# Altium schematic sheet power.schdoc
size 400 x 277 mm; Device: default420x297; Symbol: default420x297; Name: default420x297; Size: "User"; Id: /; File: power; Sheet: /
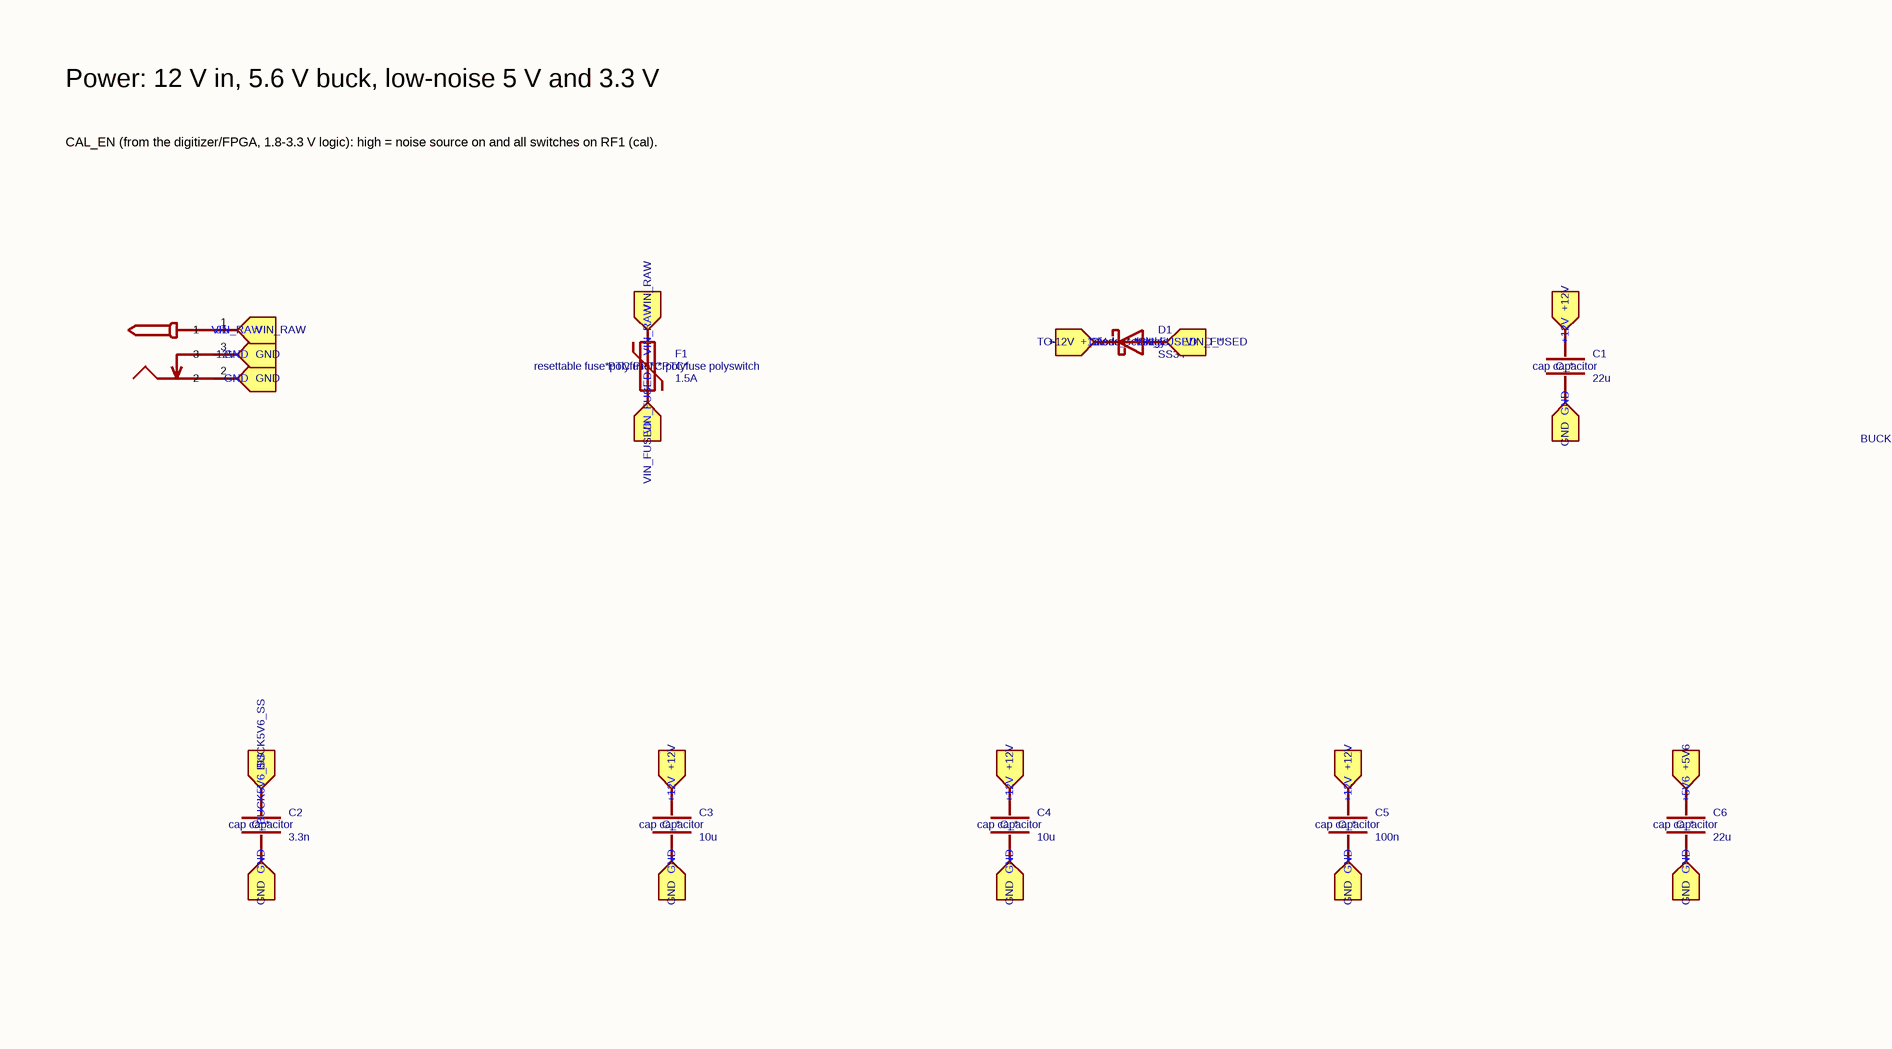
[diagram p0: power.schdoc, top left]
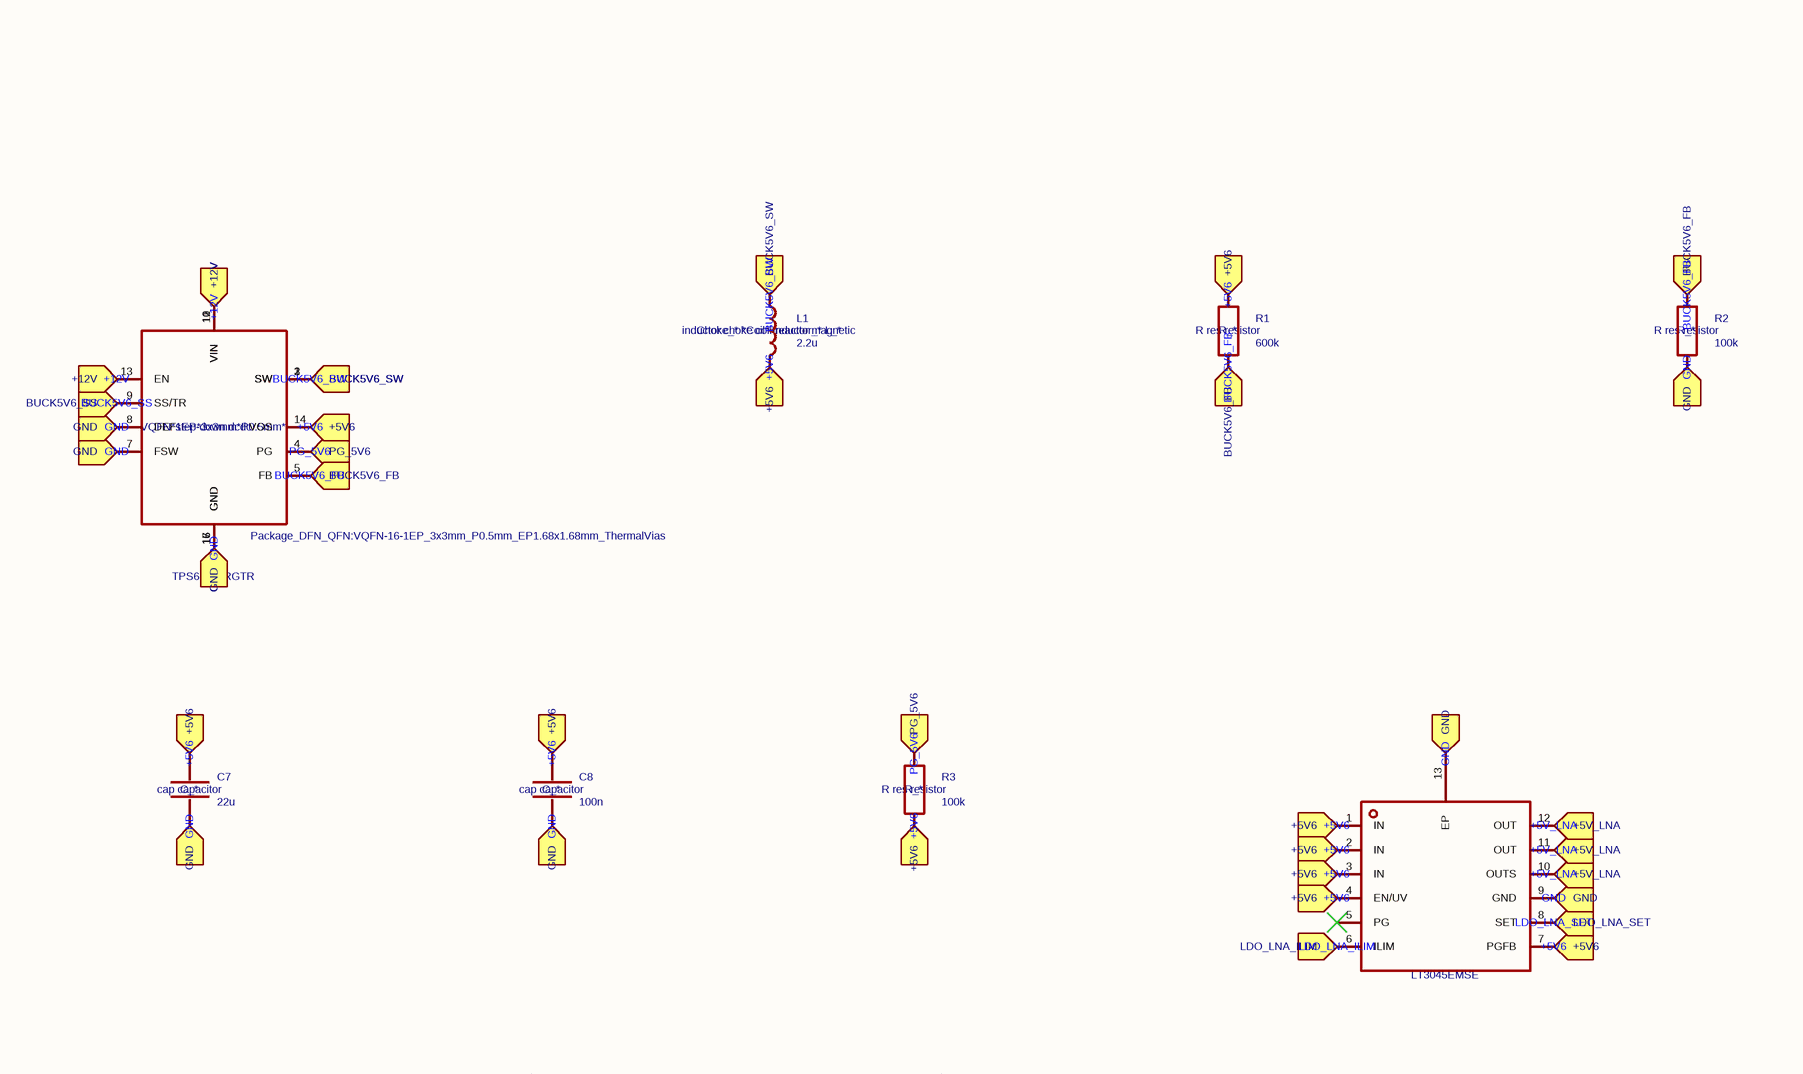
[diagram p1: power.schdoc, top right]
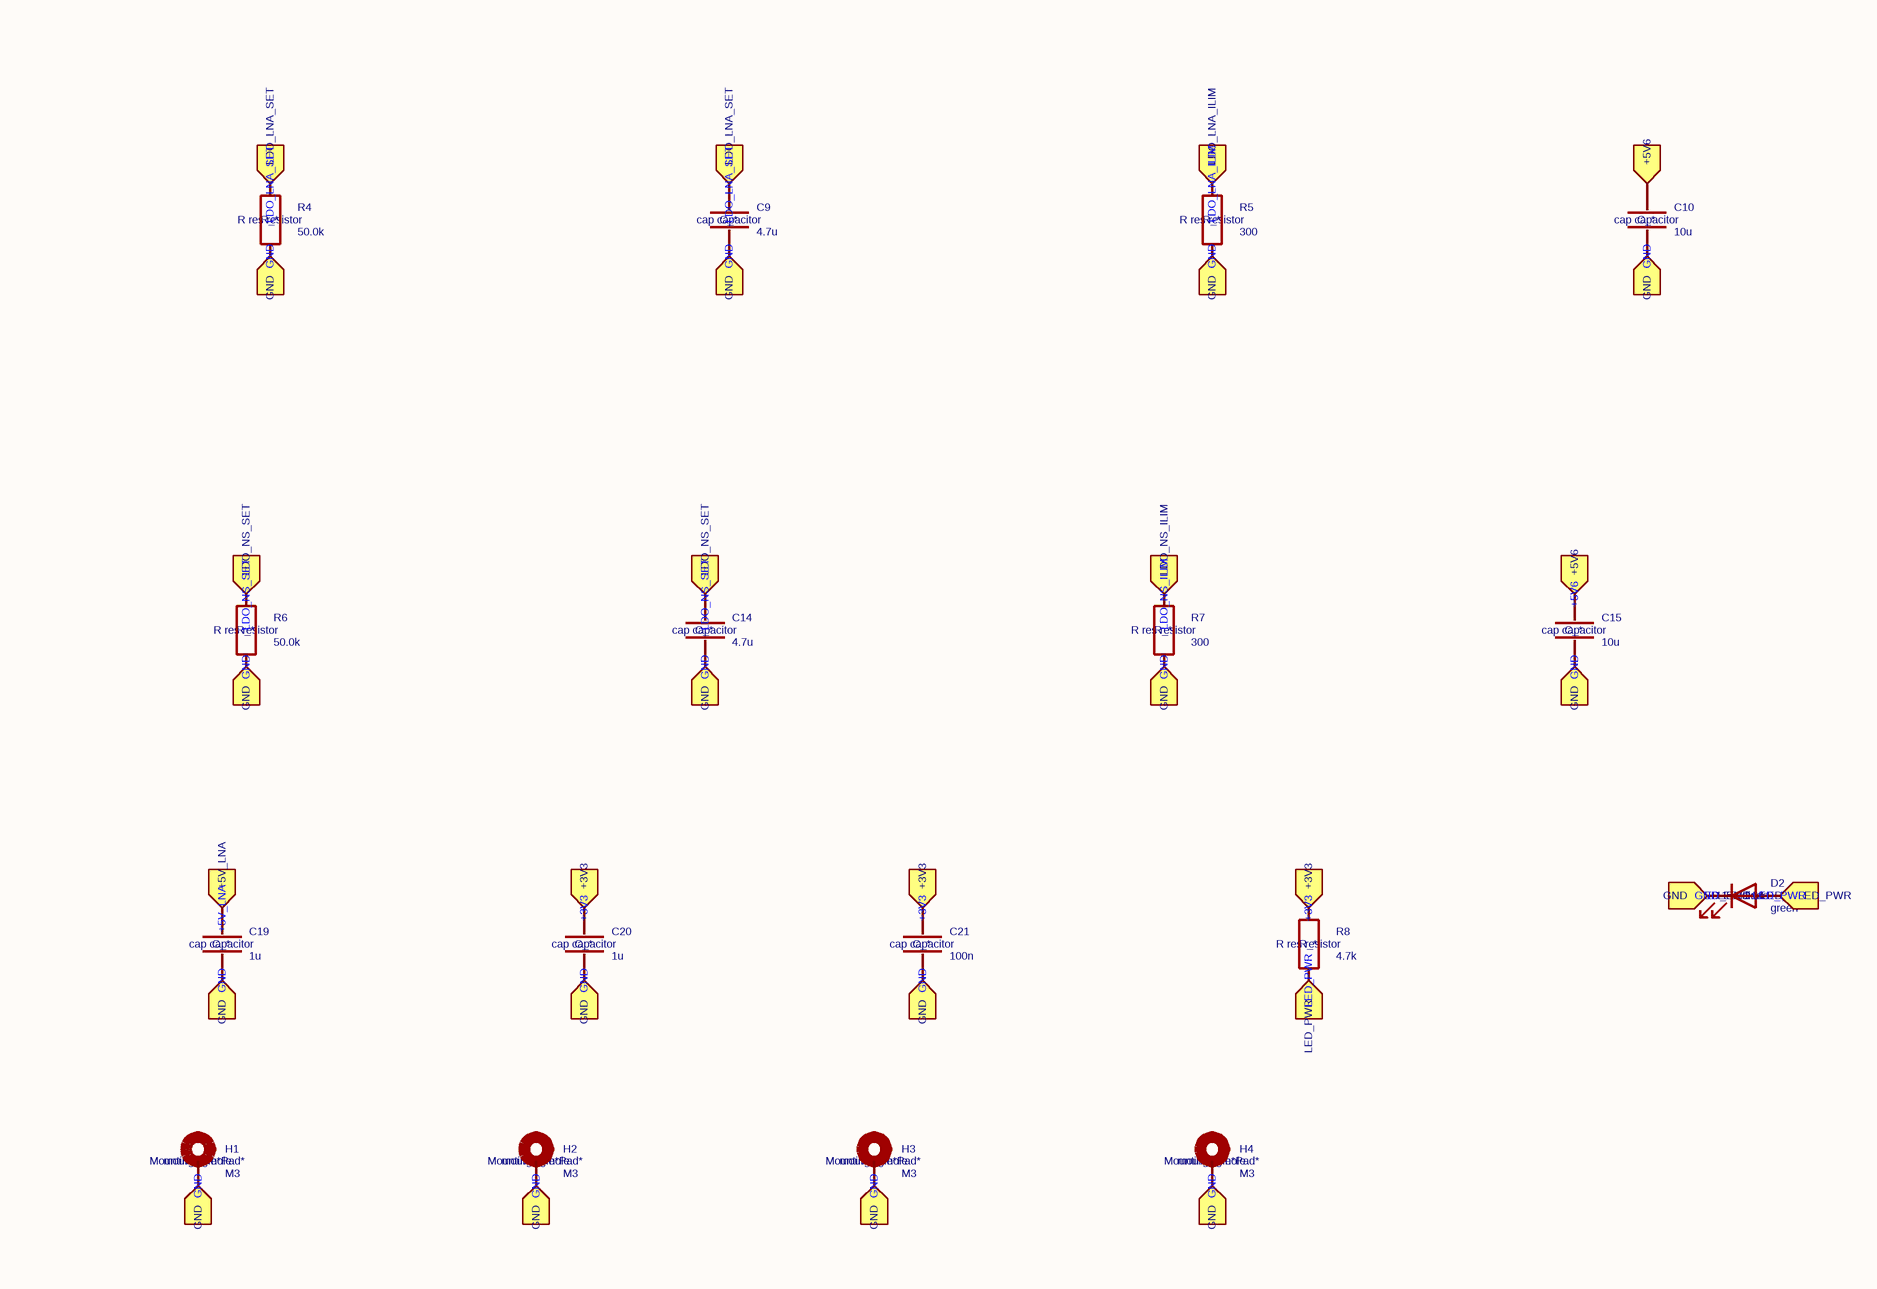
[diagram p2: power.schdoc, bottom left]
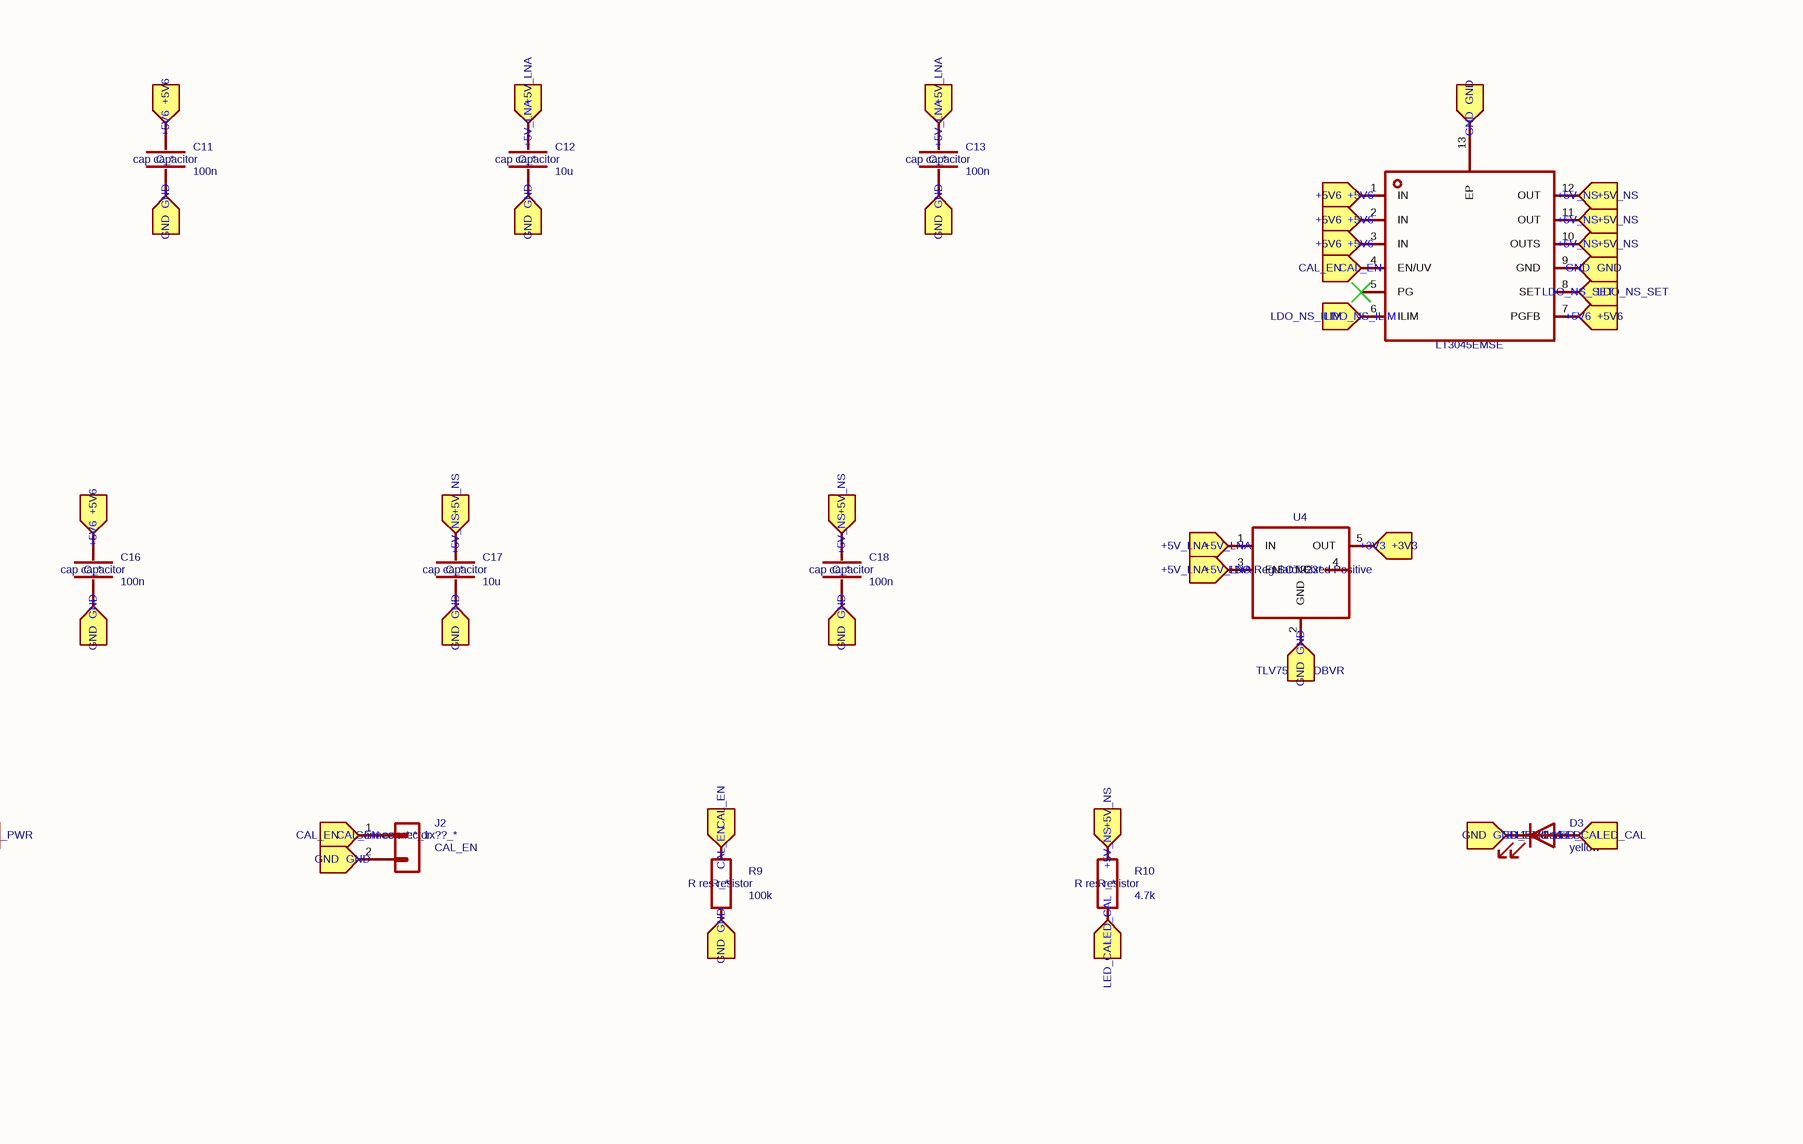
[diagram p3: power.schdoc, bottom right]

## Parts
C1  value 22u  ki_keywords: cap capacitor  ki_fp_filters: C_*  [Capacitor_SMD:C_1206_3216Metric]  (hidden comment: Device_C)
C2  value 3.3n  ki_keywords: cap capacitor  ki_fp_filters: C_*  [Capacitor_SMD:C_0402_1005Metric]  (hidden comment: Device_C)
C3  value 10u  ki_keywords: cap capacitor  ki_fp_filters: C_*  [Capacitor_SMD:C_0805_2012Metric]  (hidden comment: Device_C)
C4  value 10u  ki_keywords: cap capacitor  ki_fp_filters: C_*  [Capacitor_SMD:C_0805_2012Metric]  (hidden comment: Device_C)
C5  value 100n  ki_keywords: cap capacitor  ki_fp_filters: C_*  [Capacitor_SMD:C_0402_1005Metric]  (hidden comment: Device_C)
C6  value 22u  ki_keywords: cap capacitor  ki_fp_filters: C_*  [Capacitor_SMD:C_0805_2012Metric]  (hidden comment: Device_C)
C7  value 22u  ki_keywords: cap capacitor  ki_fp_filters: C_*  [Capacitor_SMD:C_0805_2012Metric]  (hidden comment: Device_C)
C8  value 100n  ki_keywords: cap capacitor  ki_fp_filters: C_*  [Capacitor_SMD:C_0402_1005Metric]  (hidden comment: Device_C)
C9  value 4.7u  ki_keywords: cap capacitor  ki_fp_filters: C_*  [Capacitor_SMD:C_0603_1608Metric]  (hidden comment: Device_C)
C10  value 10u  ki_keywords: cap capacitor  ki_fp_filters: C_*  [Capacitor_SMD:C_0603_1608Metric]  (hidden comment: Device_C)
C11  value 100n  ki_keywords: cap capacitor  ki_fp_filters: C_*  [Capacitor_SMD:C_0402_1005Metric]  (hidden comment: Device_C)
C12  value 10u  ki_keywords: cap capacitor  ki_fp_filters: C_*  [Capacitor_SMD:C_0603_1608Metric]  (hidden comment: Device_C)
C13  value 100n  ki_keywords: cap capacitor  ki_fp_filters: C_*  [Capacitor_SMD:C_0402_1005Metric]  (hidden comment: Device_C)
C14  value 4.7u  ki_keywords: cap capacitor  ki_fp_filters: C_*  [Capacitor_SMD:C_0603_1608Metric]  (hidden comment: Device_C)
C15  value 10u  ki_keywords: cap capacitor  ki_fp_filters: C_*  [Capacitor_SMD:C_0603_1608Metric]  (hidden comment: Device_C)
C16  value 100n  ki_keywords: cap capacitor  ki_fp_filters: C_*  [Capacitor_SMD:C_0402_1005Metric]  (hidden comment: Device_C)
C17  value 10u  ki_keywords: cap capacitor  ki_fp_filters: C_*  [Capacitor_SMD:C_0603_1608Metric]  (hidden comment: Device_C)
C18  value 100n  ki_keywords: cap capacitor  ki_fp_filters: C_*  [Capacitor_SMD:C_0402_1005Metric]  (hidden comment: Device_C)
C19  value 1u  ki_keywords: cap capacitor  ki_fp_filters: C_*  [Capacitor_SMD:C_0402_1005Metric]  (hidden comment: Device_C)
C20  value 1u  ki_keywords: cap capacitor  ki_fp_filters: C_*  [Capacitor_SMD:C_0402_1005Metric]  (hidden comment: Device_C)
C21  value 100n  ki_keywords: cap capacitor  ki_fp_filters: C_*  [Capacitor_SMD:C_0402_1005Metric]  (hidden comment: Device_C)
D1  value SS34  ki_keywords: diode Schottky  ki_fp_filters: TO-???* *_Diode_* *SingleDiode* D_*  [Diode_SMD:D_SMA]  (hidden comment: Device_D_Schottky)
D2  value green  Sim.Pins: 1=K 2=A  ki_keywords: LED diode  ki_fp_filters: LED* LED_SMD:* LED_THT:*  [LED_SMD:LED_0603_1608Metric]  (hidden comment: Device_LED)
D3  value yellow  Sim.Pins: 1=K 2=A  ki_keywords: LED diode  ki_fp_filters: LED* LED_SMD:* LED_THT:*  [LED_SMD:LED_0603_1608Metric]  (hidden comment: Device_LED)
F1  value 1.5A  ki_keywords: resettable fuse PTC PPTC polyfuse polyswitch  ki_fp_filters: *polyfuse* *PTC*  [Fuse:Fuse_1206_3216Metric]  (hidden comment: Device_Polyfuse)
H1  value M3  ki_keywords: mounting hole  ki_fp_filters: MountingHole*Pad*  [MountingHole:MountingHole_3.2mm_M3_Pad_Via]  (hidden comment: Mechanical_MountingHole_Pad)
H2  value M3  ki_keywords: mounting hole  ki_fp_filters: MountingHole*Pad*  [MountingHole:MountingHole_3.2mm_M3_Pad_Via]  (hidden comment: Mechanical_MountingHole_Pad)
H3  value M3  ki_keywords: mounting hole  ki_fp_filters: MountingHole*Pad*  [MountingHole:MountingHole_3.2mm_M3_Pad_Via]  (hidden comment: Mechanical_MountingHole_Pad)
H4  value M3  ki_keywords: mounting hole  ki_fp_filters: MountingHole*Pad*  [MountingHole:MountingHole_3.2mm_M3_Pad_Via]  (hidden comment: Mechanical_MountingHole_Pad)
J1  value 12V DC  [prc:DC-IN-TH_DC-005C-20A]  (hidden comment: prc_DC-005C-20A)
J2  value CAL_EN  ki_keywords: connector  ki_fp_filters: Connector*:*_1x??_*  [Connector_PinHeader_2.54mm:PinHeader_1x02_P2.54mm_Vertical]  (hidden comment: Connector_Generic_Conn_01x02)
L1  value 2.2u  ki_keywords: inductor choke coil reactor magnetic  ki_fp_filters: Choke_* *Coil* Inductor_* L_*  [Inductor_SMD:L_Bourns-SRN4018]  (hidden comment: Device_L)
R1  value 600k  ki_keywords: R res resistor  ki_fp_filters: R_*  [Resistor_SMD:R_0402_1005Metric]  (hidden comment: Device_R)
R2  value 100k  ki_keywords: R res resistor  ki_fp_filters: R_*  [Resistor_SMD:R_0402_1005Metric]  (hidden comment: Device_R)
R3  value 100k  ki_keywords: R res resistor  ki_fp_filters: R_*  [Resistor_SMD:R_0402_1005Metric]  (hidden comment: Device_R)
R4  value 50.0k  ki_keywords: R res resistor  ki_fp_filters: R_*  [Resistor_SMD:R_0402_1005Metric]  (hidden comment: Device_R)
R5  value 300  ki_keywords: R res resistor  ki_fp_filters: R_*  [Resistor_SMD:R_0402_1005Metric]  (hidden comment: Device_R)
R6  value 50.0k  ki_keywords: R res resistor  ki_fp_filters: R_*  [Resistor_SMD:R_0402_1005Metric]  (hidden comment: Device_R)
R7  value 300  ki_keywords: R res resistor  ki_fp_filters: R_*  [Resistor_SMD:R_0402_1005Metric]  (hidden comment: Device_R)
R8  value 4.7k  ki_keywords: R res resistor  ki_fp_filters: R_*  [Resistor_SMD:R_0402_1005Metric]  (hidden comment: Device_R)
R9  value 100k  ki_keywords: R res resistor  ki_fp_filters: R_*  [Resistor_SMD:R_0402_1005Metric]  (hidden comment: Device_R)
R10  value 4.7k  ki_keywords: R res resistor  ki_fp_filters: R_*  [Resistor_SMD:R_0402_1005Metric]  (hidden comment: Device_R)
U1  value TPS62130RGTR  ki_keywords: step-down dcdc  ki_fp_filters: VQFN*1EP*3x3mm*P0.5mm*  Origin Footprint: Package_DFN_QFN:VQFN-16-1EP_3x3mm_P0.5mm_EP1.68x1.68mm_ThermalVias  [Package_DFN_QFN:VQFN-16-1EP_3x3mm_P0.5mm_EP1.68x1.68mm]  (hidden comment: Regulator_Switching_TPS62130)
U2  value LT3045EMSE  [prc:MSOP-12_L4.0-W3.0-P0.65-LS4.9-BL-EP]  (hidden comment: prc_LT3045EMSE#PBF)
U3  value LT3045EMSE  [prc:MSOP-12_L4.0-W3.0-P0.65-LS4.9-BL-EP]  (hidden comment: prc_LT3045EMSE#PBF)
U4  value TLV75533PDBVR  ki_keywords: LDO Regulator Fixed Positive  ki_fp_filters: SOT?23*  [Package_TO_SOT_SMD:SOT-23-5]  (hidden comment: Regulator_Linear_TLV75533PDBV)

## Ports
+3V3 (in), +5V6 (in), +5V_LNA (in), +5V_NS (in), +12V (in), BUCK5V6_FB (in), BUCK5V6_SS (in), BUCK5V6_SW (in), CAL_EN (in), GND (in), LDO_LNA_ILIM (in), LDO_LNA_SET (in), LDO_NS_ILIM (in), LDO_NS_SET (in), LED_CAL (in), LED_PWR (in), PG_5V6 (in), VIN_FUSED (in), VIN_RAW (in)

## Nets
+3V3: C20.1 C21.1 R8.1 U4.5(OUT) ; port +3V3
+5V6: C6.1 C7.1 C8.1 C10.1 C11.1 C15.1 C16.1 L1.2 R1.1 R3.2 U1.14(VOS) U2.1(IN) U2.2(IN) U2.3(IN) U2.4(EN/UV) U2.7(PGFB) U3.1(IN) U3.2(IN) U3.3(IN) U3.7(PGFB) ; port +5V6
+5V_LNA: C12.1 C13.1 C19.1 U2.10(OUTS) U2.11(OUT) U2.12(OUT) U4.1(IN) U4.3(EN) ; port +5V_LNA
+5V_NS: C17.1 C18.1 R10.1 U3.10(OUTS) U3.11(OUT) U3.12(OUT) ; port +5V_NS
+12V: C1.1 C3.1 C4.1 C5.1 D1.1(K) U1.10(VIN) U1.11(VIN) U1.12(VIN) U1.13(EN) ; port +12V
BUCK5V6_FB: R1.2 R2.1 U1.5(FB) ; port BUCK5V6_FB
BUCK5V6_SS: C2.1 U1.9(SS/TR) ; port BUCK5V6_SS
BUCK5V6_SW: L1.1 U1.1(SW) U1.2(SW) U1.3(SW) ; port BUCK5V6_SW
CAL_EN: J2.1(Pin_1) R9.1 U3.4(EN/UV) ; port CAL_EN
GND: C1.2 C2.2 C3.2 C4.2 C5.2 C6.2 C7.2 C8.2 C9.2 C10.2 C11.2 C12.2 C13.2 C14.2 C15.2 C16.2 C17.2 C18.2 C19.2 C20.2 C21.2 D2.1(K) D3.1(K) H1.1 H2.1 H3.1 H4.1 J1.2 J1.3 J2.2(Pin_2) R2.2 R4.2 R5.2 R6.2 R7.2 R9.2 U1.6(GND) U1.7(FSW) U1.8(DEF) U1.15(GND) U1.16(GND) U1.17(GND) U2.9(GND) U2.13(EP) U3.9(GND) U3.13(EP) U4.2(GND) ; port GND
LDO_LNA_ILIM: R5.1 U2.6(ILIM) ; port LDO_LNA_ILIM
LDO_LNA_SET: C9.1 R4.1 U2.8(SET) ; port LDO_LNA_SET
LDO_NS_ILIM: R7.1 U3.6(ILIM) ; port LDO_NS_ILIM
LDO_NS_SET: C14.1 R6.1 U3.8(SET) ; port LDO_NS_SET
LED_CAL: D3.2(A) R10.2 ; port LED_CAL
LED_PWR: D2.2(A) R8.2 ; port LED_PWR
PG_5V6: R3.1 U1.4(PG) ; port PG_5V6
VIN_FUSED: D1.2(A) F1.2 ; port VIN_FUSED
VIN_RAW: F1.1 J1.1 ; port VIN_RAW

Not connected (* = marked no-connect by the designer): U2 5(PG)*; U3 5(PG)*; U4 4(NC)

## Notes on the sheet
- Power: 12 V in, 5.6 V buck, low-noise 5 V and 3.3 V
- CAL_EN (from the digitizer/FPGA, 1.8-3.3 V logic): high = noise source on and all switches on RF1 (cal).
- 1
- 2
- 3
- 4
- 5
- 6
- 7
- 8
- A
- B
- C
- D
- E
- Size:"User"
- Title:
- File:power
- Sheet:/
- Date:
- Rev:
- F
- Id:/

## Library data of the parts
C1 = Device_C: UniqueId: b4693cfd16d534cd; KiLib_Generator: SMD_2terminal_chip_molded; AddInBom: yes; Device: Device_C; Symbol: Device_C; FootprintName: Capacitor_SMD:C_1206_3216Metric
C2 = Device_C: UniqueId: a2c5d49bc5dde298; KiLib_Generator: SMD_2terminal_chip_molded; AddInBom: yes; Device: Device_C; Symbol: Device_C; FootprintName: Capacitor_SMD:C_0402_1005Metric
C3 = Device_C: UniqueId: cc82bf2c2e22e605; KiLib_Generator: SMD_2terminal_chip_molded; AddInBom: yes; Device: Device_C; Symbol: Device_C; FootprintName: Capacitor_SMD:C_0805_2012Metric
C4 = Device_C: UniqueId: 3a68d3ddabf48558; KiLib_Generator: SMD_2terminal_chip_molded; AddInBom: yes; Device: Device_C; Symbol: Device_C; FootprintName: Capacitor_SMD:C_0805_2012Metric
C5 = Device_C: UniqueId: ddba3c46cf8b8e66; KiLib_Generator: SMD_2terminal_chip_molded; AddInBom: yes; Device: Device_C; Symbol: Device_C; LCSC: C1525; FootprintName: Capacitor_SMD:C_0402_1005Metric
C6 = Device_C: UniqueId: ab4a8fe24fad9fe4; KiLib_Generator: SMD_2terminal_chip_molded; AddInBom: yes; Device: Device_C; Symbol: Device_C; LCSC: C45783; FootprintName: Capacitor_SMD:C_0805_2012Metric
C7 = Device_C: UniqueId: 48d2dd422533522c; KiLib_Generator: SMD_2terminal_chip_molded; AddInBom: yes; Device: Device_C; Symbol: Device_C; LCSC: C45783; FootprintName: Capacitor_SMD:C_0805_2012Metric
C8 = Device_C: UniqueId: 80f3708378e3d903; KiLib_Generator: SMD_2terminal_chip_molded; AddInBom: yes; Device: Device_C; Symbol: Device_C; LCSC: C1525; FootprintName: Capacitor_SMD:C_0402_1005Metric
C9 = Device_C: UniqueId: 7ddfd2f632a8b17d; KiLib_Generator: SMD_2terminal_chip_molded; AddInBom: yes; Device: Device_C; Symbol: Device_C; FootprintName: Capacitor_SMD:C_0603_1608Metric
C10 = Device_C: UniqueId: 3e75135af30e0f04; KiLib_Generator: SMD_2terminal_chip_molded; AddInBom: yes; Device: Device_C; Symbol: Device_C; LCSC: C19702; FootprintName: Capacitor_SMD:C_0603_1608Metric
C11 = Device_C: UniqueId: 20764de07767b3a1; KiLib_Generator: SMD_2terminal_chip_molded; AddInBom: yes; Device: Device_C; Symbol: Device_C; LCSC: C1525; FootprintName: Capacitor_SMD:C_0402_1005Metric
C12 = Device_C: UniqueId: 26a39bcafcc8ce7c; KiLib_Generator: SMD_2terminal_chip_molded; AddInBom: yes; Device: Device_C; Symbol: Device_C; LCSC: C19702; FootprintName: Capacitor_SMD:C_0603_1608Metric
C13 = Device_C: UniqueId: e7ba3aba9f9889c8; KiLib_Generator: SMD_2terminal_chip_molded; AddInBom: yes; Device: Device_C; Symbol: Device_C; LCSC: C1525; FootprintName: Capacitor_SMD:C_0402_1005Metric
C14 = Device_C: UniqueId: 00361082df9d4549; KiLib_Generator: SMD_2terminal_chip_molded; AddInBom: yes; Device: Device_C; Symbol: Device_C; FootprintName: Capacitor_SMD:C_0603_1608Metric
C15 = Device_C: UniqueId: 86bb77bda672094d; KiLib_Generator: SMD_2terminal_chip_molded; AddInBom: yes; Device: Device_C; Symbol: Device_C; LCSC: C19702; FootprintName: Capacitor_SMD:C_0603_1608Metric
C16 = Device_C: UniqueId: c8e923f96b539988; KiLib_Generator: SMD_2terminal_chip_molded; AddInBom: yes; Device: Device_C; Symbol: Device_C; LCSC: C1525; FootprintName: Capacitor_SMD:C_0402_1005Metric
C17 = Device_C: UniqueId: 48700c84863a802e; KiLib_Generator: SMD_2terminal_chip_molded; AddInBom: yes; Device: Device_C; Symbol: Device_C; LCSC: C19702; FootprintName: Capacitor_SMD:C_0603_1608Metric
C18 = Device_C: UniqueId: d9d0285421fe3ef0; KiLib_Generator: SMD_2terminal_chip_molded; AddInBom: yes; Device: Device_C; Symbol: Device_C; LCSC: C1525; FootprintName: Capacitor_SMD:C_0402_1005Metric
C19 = Device_C: UniqueId: 9b75bd895f0e39d2; KiLib_Generator: SMD_2terminal_chip_molded; AddInBom: yes; Device: Device_C; Symbol: Device_C; LCSC: C52923; FootprintName: Capacitor_SMD:C_0402_1005Metric
C20 = Device_C: UniqueId: 97d7532320e593d5; KiLib_Generator: SMD_2terminal_chip_molded; AddInBom: yes; Device: Device_C; Symbol: Device_C; LCSC: C52923; FootprintName: Capacitor_SMD:C_0402_1005Metric
C21 = Device_C: UniqueId: 0259cc883dd91c7a; KiLib_Generator: SMD_2terminal_chip_molded; AddInBom: yes; Device: Device_C; Symbol: Device_C; LCSC: C1525; FootprintName: Capacitor_SMD:C_0402_1005Metric
D1 = Device_D_Schottky: UniqueId: 6eb2f7ba7a12821c; AddInBom: yes; Device: Device_D_Schottky; Symbol: Device_D_Schottky; LCSC: C8678; MPN: SS34; FootprintName: Diode_SMD:D_SMA
D2 = Device_LED: UniqueId: cca08e5caf06c018; KiLib_Generator: SMD_2terminal_chip_molded; AddInBom: yes; Device: Device_LED; Symbol: Device_LED; FootprintName: LED_SMD:LED_0603_1608Metric
D3 = Device_LED: UniqueId: 81689f1d3303caec; KiLib_Generator: SMD_2terminal_chip_molded; AddInBom: yes; Device: Device_LED; Symbol: Device_LED; FootprintName: LED_SMD:LED_0603_1608Metric
F1 = Device_Polyfuse: UniqueId: 09f31a4987c8a883; KiLib_Generator: SMD_2terminal_chip_molded; AddInBom: yes; Device: Device_Polyfuse; Symbol: Device_Polyfuse; FootprintName: Fuse:Fuse_1206_3216Metric
H1 = Mechanical_MountingHole_Pad: UniqueId: 42baa21c67f8a3af; KiLib_Generator: mounting_hardware/mounting_hole; AddInBom: yes; Device: Mechanical_MountingHole_Pad; Symbol: Mechanical_MountingHole_Pad; FootprintName: MountingHole:MountingHole_3.2mm_M3_Pad_Via
H2 = Mechanical_MountingHole_Pad: UniqueId: b7e18a508253e952; KiLib_Generator: mounting_hardware/mounting_hole; AddInBom: yes; Device: Mechanical_MountingHole_Pad; Symbol: Mechanical_MountingHole_Pad; FootprintName: MountingHole:MountingHole_3.2mm_M3_Pad_Via
H3 = Mechanical_MountingHole_Pad: UniqueId: 0c3ab7284e9cbe73; KiLib_Generator: mounting_hardware/mounting_hole; AddInBom: yes; Device: Mechanical_MountingHole_Pad; Symbol: Mechanical_MountingHole_Pad; FootprintName: MountingHole:MountingHole_3.2mm_M3_Pad_Via
H4 = Mechanical_MountingHole_Pad: UniqueId: a89bd88a2d6d819d; KiLib_Generator: mounting_hardware/mounting_hole; AddInBom: yes; Device: Mechanical_MountingHole_Pad; Symbol: Mechanical_MountingHole_Pad; FootprintName: MountingHole:MountingHole_3.2mm_M3_Pad_Via
J1 = prc_DC-005C-20A: Manufacturer: 韩国韩荣; ki_keywords: AC/DC Power Connectors; ki_description: DC-005 2.0mm; UniqueId: 51bfc0e5166a1c40; AddInBom: yes; Device: prc_DC-005C-20A; Symbol: prc_DC-005C-20A; UserDocLink: https://lcsc.com/product-detail/DC-Connectors_high-quality-DC-005-Inner-core2-0mm_C84007.html; LCSC: C84007; MPN: DC-005C-20A; LCSC Part: C84007; FootprintName: prc:DC-IN-TH_DC-005C-20A
J2 = Connector_Generic_Conn_01x02: UniqueId: 1fb9863844ab5169; KiLib_Generator: connector/pin_header_socket; AddInBom: yes; Device: Connector_Generic_Conn_01x02; Symbol: Connector_Generic_Conn_01x02; FootprintName: Connector_PinHeader_2.54mm:PinHeader_1x02_P2.54mm_Vertical
L1 = Device_L: MPN: SRN4018-2R2M; UniqueId: d450ceac7adb81c3; AddInBom: yes; Device: Device_L; Symbol: Device_L; FootprintName: Inductor_SMD:L_Bourns-SRN4018
R1 = Device_R: UniqueId: 353b166cc2dee846; KiLib_Generator: SMD_2terminal_chip_molded; AddInBom: yes; Device: Device_R; Symbol: Device_R; FootprintName: Resistor_SMD:R_0402_1005Metric
R2 = Device_R: UniqueId: 6f63fc6711cfa315; KiLib_Generator: SMD_2terminal_chip_molded; AddInBom: yes; Device: Device_R; Symbol: Device_R; LCSC: C25741; FootprintName: Resistor_SMD:R_0402_1005Metric
R3 = Device_R: UniqueId: fe89d0632cfce75f; KiLib_Generator: SMD_2terminal_chip_molded; AddInBom: yes; Device: Device_R; Symbol: Device_R; LCSC: C25741; FootprintName: Resistor_SMD:R_0402_1005Metric
R4 = Device_R: Tolerance: 0.1%; UniqueId: fdc86a4b576d9e98; KiLib_Generator: SMD_2terminal_chip_molded; AddInBom: yes; Device: Device_R; Symbol: Device_R; FootprintName: Resistor_SMD:R_0402_1005Metric
R5 = Device_R: UniqueId: 9cdd622c9eeecfe7; KiLib_Generator: SMD_2terminal_chip_molded; AddInBom: yes; Device: Device_R; Symbol: Device_R; FootprintName: Resistor_SMD:R_0402_1005Metric
R6 = Device_R: Tolerance: 0.1%; UniqueId: e06ccd13940482ac; KiLib_Generator: SMD_2terminal_chip_molded; AddInBom: yes; Device: Device_R; Symbol: Device_R; FootprintName: Resistor_SMD:R_0402_1005Metric
R7 = Device_R: UniqueId: ba2c6d155e7fd301; KiLib_Generator: SMD_2terminal_chip_molded; AddInBom: yes; Device: Device_R; Symbol: Device_R; FootprintName: Resistor_SMD:R_0402_1005Metric
R8 = Device_R: UniqueId: 86d447fa2a9c8586; KiLib_Generator: SMD_2terminal_chip_molded; AddInBom: yes; Device: Device_R; Symbol: Device_R; LCSC: C25900; FootprintName: Resistor_SMD:R_0402_1005Metric
R9 = Device_R: UniqueId: 1e1ffada38203b9e; KiLib_Generator: SMD_2terminal_chip_molded; AddInBom: yes; Device: Device_R; Symbol: Device_R; LCSC: C25741; FootprintName: Resistor_SMD:R_0402_1005Metric
R10 = Device_R: UniqueId: 41bc0941336b1513; KiLib_Generator: SMD_2terminal_chip_molded; AddInBom: yes; Device: Device_R; Symbol: Device_R; LCSC: C25900; FootprintName: Resistor_SMD:R_0402_1005Metric
U1 = Regulator_Switching_TPS62130: UniqueId: 1bdc0ab44f99f92d; KiLib_Generator: package/no_lead; AddInBom: yes; Device: Regulator_Switching_TPS62130; Symbol: Regulator_Switching_TPS62130; UserDocLink: http://www.ti.com/lit/ds/symlink/tps62130.pdf; LCSC: C43590; MPN: TPS62130RGTR; FootprintName: Package_DFN_QFN:VQFN-16-1EP_3x3mm_P0.5mm_EP1.68x1.68mm
U2 = prc_LT3045EMSE#PBF: Manufacturer: ADI(亚德诺); ki_keywords: Linear Voltage Regulators (LDO); UniqueId: 48f0ae2437312dae; AddInBom: yes; Device: prc_LT3045EMSE#PBF; Symbol: prc_LT3045EMSE#PBF; UserDocLink: https://lcsc.com/product-detail/Pre-ordered-Products_Analog-Devices_LT3045EMSE-PBF_Analog-Devices-ADI-LINEAR-LT3045EMSE-PBF_C580012.html; LCSC: C580012; MPN: LT3045EMSE#PBF; LCSC Part: C580012; FootprintName: prc:MSOP-12_L4.0-W3.0-P0.65-LS4.9-BL-EP
U3 = prc_LT3045EMSE#PBF: Manufacturer: ADI(亚德诺); ki_keywords: Linear Voltage Regulators (LDO); UniqueId: 66797bcd97f4f6c2; AddInBom: yes; Device: prc_LT3045EMSE#PBF; Symbol: prc_LT3045EMSE#PBF; UserDocLink: https://lcsc.com/product-detail/Pre-ordered-Products_Analog-Devices_LT3045EMSE-PBF_Analog-Devices-ADI-LINEAR-LT3045EMSE-PBF_C580012.html; LCSC: C580012; MPN: LT3045EMSE#PBF; LCSC Part: C580012; FootprintName: prc:MSOP-12_L4.0-W3.0-P0.65-LS4.9-BL-EP
U4 = Regulator_Linear_TLV75533PDBV: UniqueId: bac468049775df37; KiLib_Generator: package/gullwing; AddInBom: yes; Device: Regulator_Linear_TLV75533PDBV; Symbol: Regulator_Linear_TLV75533PDBV; UserDocLink: http://www.ti.com/lit/ds/symlink/tlv755p.pdf; LCSC: C404027; FootprintName: Package_TO_SOT_SMD:SOT-23-5